# Altium project EMG-Arm-ELEC-V2.0.PrjPcb (part 4 of 4)

## Sheet Electrode_Sheet8.SchDoc
size 420 x 297 mm
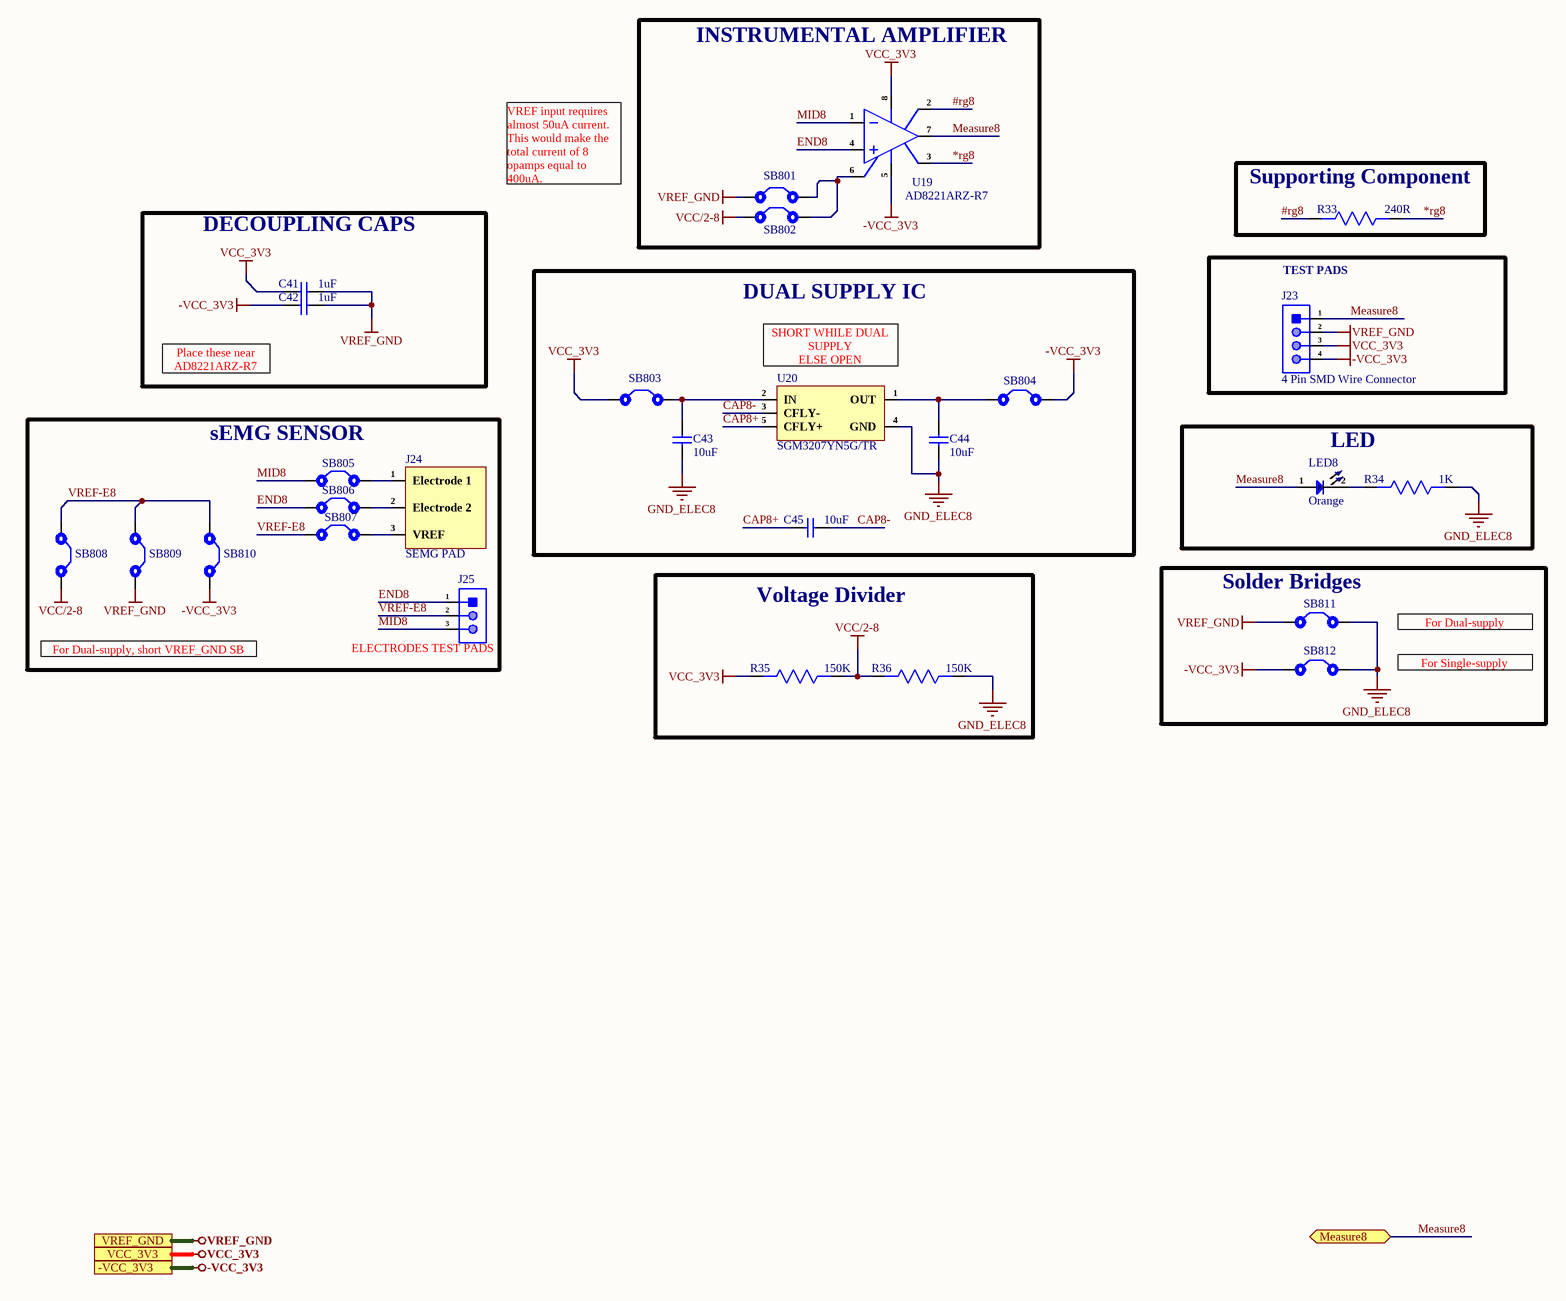
[diagram p10: Electrode_Sheet8.SchDoc]

### Parts
C41  1uF  [Cap-0402]
C42  1uF  [Cap-0402]
C43  10uF  [Cap-0603]
C44  10uF  [Cap-0603]
C45  10uF  [Cap-0603]
J23  4 Pin SMD Wire Connector  [4 Pin SMD Wire CON.]  (no BOM)
J24  SEMG PAD  [SEMG-PAD]
J25  Test Pad SMD 3 Pin  [Test Pad (SMD 3 Pin)]  (value not drawn)  (no BOM)
LED8  Orange  [LED-0603]
R33  240R  [Res-0402]
R34  1K  [Res-0402]
R35  150K  [Res-0402]
R36  150K  [Res-0402]
SB801  Solder Bridge 0402  [Solder Bridge 0402]  (value not drawn)  (no BOM)
SB802  Solder Bridge 0402  [Solder Bridge 0402]  (value not drawn)  (no BOM)
SB803  Solder Bridge 0402  [Solder Bridge 0402]  (value not drawn)  (no BOM)
SB804  Solder Bridge 0402  [Solder Bridge 0402]  (value not drawn)  (no BOM)
SB805  Solder Bridge 0402  [Solder Bridge 0402]  (value not drawn)  (no BOM)
SB806  Solder Bridge 0402  [Solder Bridge 0402]  (value not drawn)  (no BOM)
SB807  Solder Bridge 0402  [Solder Bridge 0402]  (value not drawn)  (no BOM)
SB808  Solder Bridge 0402  [Solder Bridge 0402]  (value not drawn)  (no BOM)
SB809  Solder Bridge 0402  [Solder Bridge 0402]  (value not drawn)  (no BOM)
SB810  Solder Bridge 0402  [Solder Bridge 0402]  (value not drawn)  (no BOM)
SB811  Solder Bridge 0402  [Solder Bridge 0402]  (value not drawn)  (no BOM)
SB812  Solder Bridge 0402  [Solder Bridge 0402]  (value not drawn)  (no BOM)
U19  AD8221ARZ-R7  [SOIC-8]
U20  SGM3207YN5G/TR  [SOT-23-5]

### Blocks framed on the sheet
INSTRUMENTAL AMPLIFIER: SB801 SB802 U19
Supporting Component: R33
DECOUPLING CAPS: C41 C42
TEST PADS: J23
DUAL SUPPLY IC: C43-C45 SB803 SB804 U20
sEMG SENSOR: J24 J25 SB805-SB810
LED: LED8 R34
Voltage Divider: R35 R36
Solder Bridges: SB811 SB812

### Ports
-VCC_3V3, Measure8 (bidir), VCC_3V3, VREF_GND

### Nets
-VCC_3V3: C42.1 J23.4 SB804.2 SB810.2 SB812.1 U19.5(V-) ; port -VCC_3V3
GND_ELEC8: C43.1 C44.1 R34.1 R36.2 SB811.2 SB812.2 U20.4(GND)
VCC/2-8: R35.2 R36.1 SB802.1 SB808.2
VCC_3V3: C41.1 J23.3 R35.1 SB803.1 U19.8(V+) ; port VCC_3V3
VREF_GND: C41.2 C42.2 J23.2 SB801.1 SB809.2 SB811.1 ; port VREF_GND
#rg8: R33.2 U19.2(RG)
*rg8: R33.1 U19.3(RG)
CAP8+: C45.1 U20.5(CFLY+)
CAP8-: C45.2 U20.3(CFLY-)
END8: J25.1 SB806.1 U19.4(IN+)
Measure8: J23.1 LED8.1 U19.7(VOUT) ; port Measure8
MID8: J25.3 SB805.1 U19.1(IN-)
VREF-E8: J25.2 SB807.1 SB808.1 SB809.1 SB810.1
NetC43_2: C43.2 SB803.2 U20.2(IN)
NetC44_2: C44.2 SB804.1 U20.1(OUT)
NetJ24_1: J24.1(Electrode_1) SB805.2
NetJ24_2: J24.2(Electrode_2) SB806.2
NetJ24_3: J24.3(VREF) SB807.2
NetLED8_2: LED8.2 R34.2
NetSB801_2: SB801.2 SB802.2 U19.6(REF)

### Notes on the sheet
- VREF input requires almost 50uA current. This would make the total current of 8 opamps equal to 400uA.
- Place these near AD8221ARZ-R7
- (near U20) SHORT WHILE DUAL SUPPLY
  ELSE OPEN
- For Dual-supply, short VREF_GND SB
- (near J25) ELECTRODES TEST PADS
- For Dual-supply
- For Single-supply
- File:
- Title:
- Date:
- Page
- Num:
- Total:
- Drawn By: Huzaifa Ali

### Library data of the parts
C41 C42 = CC0402KRX5R7BB105: CAP CER 1UF 16V X5R 0402; Manufacturer: Yageo; Tolerance: 10%; Item Type: Capacitor; Supplier 1: Digi-Key; Manufacturer Part Number: CC0402KRX5R7BB105; Stock 1: 1405667; Pricing 1: 1=0.36, 10=0.252, 100=0.1512, 500=0.1134, 1000=0.09576, 2500=0.09072, 5000=0.08568 (USD); Mount: Surface Mount; Case/Package: 0402; Weight: 2.3E-05oz; Case Code (Imperial): 0402; Case Code (Metric): 1005; Min Operating Temperature: -55°C; Max Operating Temperature: 85°C; Capacitance: 1uF; Dielectric: X5R; Packaging: Tape and Reel; Voltage Rating (DC): 16V; Voltage Rating: 16V; Termination: SMD/SMT; Composition: Ceramic; Length: 1mm; Height: 0.5mm; Width: 0.02inch; Thickness: 0.022inch; Depth: 0.5mm; Radiation Hardening: No; Lead Free: Lead Free; Halogen Free: Halogen Free; ComponentLink1URL: http://www.yageo.com/documents/recent/UPY-GPHC_X5R_4V-to-50V_12.pdf?src-supplier=Avnet+Europe; ComponentLink1Description: http://www.yageo.com/documents/recent/UPY-GPHC_X5R_4V-to-50V_12.pdf?src-supplier=Avnet+Europe; Supplier Part Number 1: 311-1691-6-ND; LCSC Part Number: C325464
C43-C45 = CL10A106MA8NRNC: CAP CER 10UF 25V X5R 0603; Manufacturer: Samsung; Tolerance: 20%; Supplier 1: Avnet; Manufacturer Part Number: CL10A106MA8NRNC; RoHS: Yes; Category: Ceramic Capacitors; Pricing 1: 4000=0.03753, 8000=0.03700, 16000=0.03595, 24000=0.03515, 32000=0.03383, 40000=0.03304, 400000=0.03225 (USD); Mount: Surface Mount; Case/Package: 0603; Case Code (Metric): 1608; Case Code (Imperial): 0603; Contact Plating: Tin; Min Operating Temperature: -55°C; Max Operating Temperature: 85°C; Package Quantity: 1; Packaging: Tape and Reel; Capacitance: 10uF; Voltage Rating: 25V; Dielectric: X5R; Termination: Wraparound; Series: CL; Construction: Flat; Length: 0.063inch; Width: 0.031inch; Thickness: 0.035inch; Lead Free: Lead Free; RoHS Compliant: Yes; ComponentLink1URL: https://datasheet.ciiva.com/25766/cl10a106ma8nrnc-25766562.pdf?src-supplier=Digi-Key; ComponentLink1Description: https://datasheet.ciiva.com/25766/cl10a106ma8nrnc-25766562.pdf?src-supplier=Digi-Key; Supplier Part Number 1: CL10A106MA8NRNC; LCSC Part Number: C96446
J23 = 4 Pin SMD Wire Connector: Wire Connecting Pads; Item Type: SMD Pads; Manufacturer Part Number: 4 Pin SMD Wire Connector
J24 = SEMG PAD: Sensor Connecting Pads
J25 = Test Pad SMD 3 Pin: Test Pad
LED8 = 19-217/S2C-AQ1R1B/3T: 0603(H=0.4mm) λD=600.5~612.5nm VR=5V VF=1.7V~2.2V IF=25mA PD=60mW; Manufacturer: Everlight; Item Type: LED; Supplier 1: Digi-Key; Manufacturer Part Number: 19-217/S2C-AQ1R1B/3T; RoHS: No; Category: LEDs; Supplier Part Number 1: 1080-19-217/S2C-AQ1R1B/3TTR-ND; LCSC Part Number: C146215; ComponentLink1Description: LCSC; ComponentLink1URL: https://www.lcsc.com/product-detail/Light-Emitting-Diodes-LED_Everlight-Elec-19-217-S2C-AQ1R1B-3T_C146215.html
R33 = RC0402FR-07240RL: RES 240 OHM 1% 1/16W 0402; Manufacturer: Yageo; Power Rating: 63mW; Temperature Coefficient: 100ppm/°C; Voltage Rating (DC): 50V; Supplier 1: Mouser; Manufacturer Part Number: RC0402FR-07240RL; RoHS: Yes; Category: Chip SMD Resistors; Stock 1: 1903202; Pricing 1: 1=0.10000, 10=0.01200, 50=0.01200, 100=0.00500, 1000=0.00300, 10000=0.00100 (USD); Case/Package: 0402; Case Code (Metric): 1005; Case Code (Imperial): 0402; Size Code: 0402; Min Operating Temperature: -55°C; Max Operating Temperature: 155°C; Resistance: 240R; Tolerance: 1%; Packaging: Tape and Reel; Resistor Type: Thick Film; Voltage Rating: 50V; Package Quantity: 1; Number of Terminations: 2; Termination: SMD/SMT; Max Power Dissipation: 63mW; Features: Moisture Resistant; Series: RC; Construction: Rectangular; Resistance Tolerance: 1%; Length: 1mm; Width: 0.02inch; Height: 0.016inch; Depth: 0.5mm; REACH SVHC: Unknown; Lead Free: Lead Free; RoHS Compliant: Yes; Military Standard: Not; ComponentLink1URL: https://datasheet.ciiva.com/7849/1018594-7849915.pdf?src-supplier=Element14; ComponentLink1Description: https://datasheet.ciiva.com/7849/1018594-7849915.pdf?src-supplier=Element14; ComponentLink2URL: https://datasheet.ciiva.com/7849/1018594-7849916.pdf?src-supplier=Element14; ComponentLink2Description: https://datasheet.ciiva.com/7849/1018594-7849916.pdf?src-supplier=Element14; ComponentLink3URL: https://datasheet.ciiva.com/2519/pyu-r-int-thick-7-2519157.pdf?src-supplier=Digi-Key; ComponentLink3Description: https://datasheet.ciiva.com/2519/pyu-r-int-thick-7-2519157.pdf?src-supplier=Digi-Key; ComponentLink4URL: https://datasheet.ciiva.com/2519/pyu-r-int-thick-7-2519158.pdf?src-supplier=Digi-Key; ComponentLink4Description: https://datasheet.ciiva.com/2519/pyu-r-int-thick-7-2519158.pdf?src-supplier=Digi-Key; ComponentLink5URL: https://datasheet.ciiva.com/2519/pyu-r-int-thick-7-2519156.pdf?src-supplier=Digi-Key; ComponentLink5Description: https://datasheet.ciiva.com/2519/pyu-r-int-thick-7-2519156.pdf?src-supplier=Digi-Key; ComponentLink6URL: https://datasheet.ciiva.com/12669/pyu-rc0402-51-rohs-l-6-r-12669689.pdf?src-supplier=Mouser; ComponentLink6Description: https://datasheet.ciiva.com/12669/pyu-rc0402-51-rohs-l-6-r-12669689.pdf?src-supplier=Mouser; ComponentLink7URL: https://datasheet.ciiva.com/17419/pyu-rc0402-51-rohs-l-6-r-17419482.pdf?src-supplier=Future+Electronics; ComponentLink7Description: https://datasheet.ciiva.com/17419/pyu-rc0402-51-rohs-l-6-r-17419482.pdf?src-supplier=Future+Electronics; Supplier Part Number 1: 603-RC0402FR-07240RL
R34 = RC0402JR-071KL: RES 1K OHM 5% 1/16W 0402; Manufacturer: Yageo; Resistance: 1kR; Power Rating: 62.5mW; Voltage Rating: 50V; Temperature Coefficient: 100ppm/°C; Max Power Dissipation: 63mW; Item Type: Resistor; Supplier 1: Digi-Key; Manufacturer Part Number: RC0402JR-071KL; RoHS: Yes; Category: Chip SMD Resistors; Stock 1: 452315; Pricing 1: 1=0.10000, 10=0.01300, 100=0.00540, 1000=0.00244, 2500=0.00212, 5000=0.00175 (USD); Case/Package: 0402; Case Code (Imperial): 0402; Case Code (Metric): 1005; Size Code: 0402; Min Operating Temperature: -55°C; Max Operating Temperature: 155°C; Tolerance: 5%; Packaging: Tape and Reel; Package Quantity: 1; Termination: SMD/SMT; Resistor Type: Thick Film; Number of Terminations: 2; Features: Moisture Resistant; Series: RC; Resistance Tolerance: 5%; Construction: Rectangular; Length: 0.039inch; Width: 0.02inch; Height: 0.016inch; Depth: 0.5mm; REACH SVHC: No SVHC; Military Standard: Not; Lead Free: Lead Free; RoHS Compliant: Yes; ComponentLink1URL: https://datasheet.ciiva.com/7983/1018594-7983558.pdf?src-supplier=Element14; ComponentLink1Description: https://datasheet.ciiva.com/7983/1018594-7983558.pdf?src-supplier=Element14; ComponentLink2URL: https://datasheet.ciiva.com/2452/pyu-r-int-thick-7-2452756.pdf?src-supplier=Digi-Key; ComponentLink2Description: https://datasheet.ciiva.com/2452/pyu-r-int-thick-7-2452756.pdf?src-supplier=Digi-Key; ComponentLink3URL: https://datasheet.ciiva.com/2452/pyu-r-int-thick-7-2452757.pdf?src-supplier=Digi-Key; ComponentLink3Description: https://datasheet.ciiva.com/2452/pyu-r-int-thick-7-2452757.pdf?src-supplier=Digi-Key; ComponentLink4URL: https://datasheet.ciiva.com/2452/pyu-r-int-thick-7-2452755.pdf?src-supplier=Digi-Key; ComponentLink4Description: https://datasheet.ciiva.com/2452/pyu-r-int-thick-7-2452755.pdf?src-supplier=Digi-Key; ComponentLink5URL: https://datasheet.ciiva.com/7850/1018594-7850170.pdf?src-supplier=Element14; ComponentLink5Description: https://datasheet.ciiva.com/7850/1018594-7850170.pdf?src-supplier=Element14; ComponentLink6URL: https://datasheet.ciiva.com/7850/1018594-7850171.pdf?src-supplier=Element14; ComponentLink6Description: https://datasheet.ciiva.com/7850/1018594-7850171.pdf?src-supplier=Element14; ComponentLink7URL: https://datasheet.ciiva.com/17081/pyu-rc0402-51-rohs-l-6-r-17081438.pdf?src-supplier=Future+Electronics; ComponentLink7Description: https://datasheet.ciiva.com/17081/pyu-rc0402-51-rohs-l-6-r-17081438.pdf?src-supplier=Future+Electronics; Supplier Part Number 1: 311-1.0KJRCT-ND; LCSC Part Number: C105637
R35 R36 = RC0402JR-07150KL: RES SMD 0402 150kOhm 5% Paper T/R; Manufacturer: Yageo; Resistance: 150kR; Power Rating: 63mW; Voltage Rating: 50V; Temperature Coefficient: 100ppm/°C; Item Type: Resistor; Supplier 1: Arrow Electronics; Manufacturer Part Number: RC0402JR-07150KL; RoHS: Yes; Category: Chip SMD Resistors; Stock 1: 170000; Pricing 1: 10000=0.00100 (USD); Case/Package: 0402; Case Code (Metric): 1005; Case Code (Imperial): 0402; Weight: 2.3E-05oz; Size Code: 0402; Min Operating Temperature: -55°C; Max Operating Temperature: 155°C; Package Quantity: 1; Tolerance: 5%; Packaging: Tape and Reel; Resistor Type: Thick Film; Number of Terminations: 2; Termination: SMD/SMT; Max Power Dissipation: 63mW; Features: Moisture Resistant; Series: RC; Construction: Rectangular; Resistance Tolerance: 5%; Length: 1mm; Width: 0.02inch; Height: 0.016inch; Depth: 0.5mm; REACH SVHC: No SVHC; Military Standard: Not; Lead Free: Lead Free; RoHS Compliant: Yes; ComponentLink1URL: https://datasheet.ciiva.com/7983/1018594-7983551.pdf?src-supplier=Element14; ComponentLink1Description: https://datasheet.ciiva.com/7983/1018594-7983551.pdf?src-supplier=Element14; ComponentLink2URL: https://datasheet.ciiva.com/2518/pyu-r-int-thick-7-2518929.pdf?src-supplier=Digi-Key; ComponentLink2Description: https://datasheet.ciiva.com/2518/pyu-r-int-thick-7-2518929.pdf?src-supplier=Digi-Key; ComponentLink3URL: https://datasheet.ciiva.com/2518/pyu-r-int-thick-7-2518930.pdf?src-supplier=Digi-Key; ComponentLink3Description: https://datasheet.ciiva.com/2518/pyu-r-int-thick-7-2518930.pdf?src-supplier=Digi-Key; ComponentLink4URL: https://datasheet.ciiva.com/2518/pyu-r-int-thick-7-2518928.pdf?src-supplier=Digi-Key; ComponentLink4Description: https://datasheet.ciiva.com/2518/pyu-r-int-thick-7-2518928.pdf?src-supplier=Digi-Key; ComponentLink5URL: https://datasheet.ciiva.com/7850/1018594-7850149.pdf?src-supplier=Element14; ComponentLink5Description: https://datasheet.ciiva.com/7850/1018594-7850149.pdf?src-supplier=Element14; ComponentLink6URL: https://datasheet.ciiva.com/17072/pyu-rc0402-51-rohs-l-6-r-17072379.pdf?src-supplier=Future+Electronics; ComponentLink6Description: https://datasheet.ciiva.com/17072/pyu-rc0402-51-rohs-l-6-r-17072379.pdf?src-supplier=Future+Electronics; ComponentLink7URL: https://datasheet.ciiva.com/15189/getdatasheetpartid-251830-15189543.pdf?src-supplier=Verical; ComponentLink7Description: https://datasheet.ciiva.com/15189/getdatasheetpartid-251830-15189543.pdf?src-supplier=Verical; Supplier Part Number 1: RC0402JR-07150KL; LCSC Part Number: C137919
SB801-SB812 = Solder Bridge 0402: Solder Bridge ON; Manufacturer Part Number: Solder Bridge 0402; Item Type: Solder Bridge
U19 = AD8221ARZ-R7: IC OPAMP INSTR 825KHZ 8SOIC; Manufacturer: Analog Devices; Number of Channels: 1; Common Mode Rejection Ratio: 80dB; Min Dual Supply Voltage: 2.3V; Max Dual Supply Voltage: 18V; Slew Rate: 2.5V/µs; Nominal Supply Current: 1mA; Max Power Dissipation: 200mW; Bandwidth: 562kHz; Input Bias Current: 1.5nA; Input Offset Voltage (Vos): 60uV; Output Current per Channel: 18mA; Power Supply Rejection Ratio (PSRR): 130dB; Voltage Gain: 60dB; Input Resistance: 100GR; Quiescent Current: 900uA; Operating Supply Voltage: 36V; Supplier 1: Mouser; Manufacturer Part Number: AD8221ARZ-R7; RoHS: Yes; Category: Amplifiers - Op Amps, Buffer, Instrumentation; Pricing 1: 1=7.37000, 10=6.66000, 25=6.35000, 50=6.35000, 100=5.51000, 250=5.27000, 500=4.80000, 1000=4.37000, 10000=4.37000 (USD); Case/Package: SOIC; Number of Pins: 8; Contact Plating: Tin,Matte; Min Operating Temperature: -40°C; Max Operating Temperature: 85°C; -3db Bandwidth: 825kHz; Package Quantity: 1000; Packaging: Tape and Reel; Number of Circuits: 1; Operating Supply Current: 1mA; Number of Elements: 1; Power Dissipation: 200mW; Series: -; Supply Current: 1mA; Radiation Hardening: No; Lead Free: Contains Lead; RoHS Compliant: Yes; ComponentLink1URL: https://datasheet.ciiva.com/15128/getdatasheetpartid-313520-15128733.pdf?src-supplier=Verical; ComponentLink1Description: https://datasheet.ciiva.com/15128/getdatasheetpartid-313520-15128733.pdf?src-supplier=Verical; ComponentLink2URL: https://datasheet.ciiva.com/2975/ad8221-2975658.pdf?src-supplier=Avnet; ComponentLink2Description: https://datasheet.ciiva.com/2975/ad8221-2975658.pdf?src-supplier=Avnet; ComponentLink3URL: https://datasheet.ciiva.com/2975/ad8221-2975980.pdf?src-supplier=Avnet; ComponentLink3Description: https://datasheet.ciiva.com/2975/ad8221-2975980.pdf?src-supplier=Avnet; ComponentLink4URL: https://datasheet.ciiva.com/6628/ad8221-6628618.pdf?src-supplier=Digi-Key; ComponentLink4Description: https://datasheet.ciiva.com/6628/ad8221-6628618.pdf?src-supplier=Digi-Key; ComponentLink5URL: https://datasheet.ciiva.com/6628/ad8221-6628619.pdf?src-supplier=Digi-Key; ComponentLink5Description: https://datasheet.ciiva.com/6628/ad8221-6628619.pdf?src-supplier=Digi-Key; ComponentLink6URL: https://datasheet.ciiva.com/6628/ad8221-6628617.pdf?src-supplier=Digi-Key; ComponentLink6Description: https://datasheet.ciiva.com/6628/ad8221-6628617.pdf?src-supplier=Digi-Key; ComponentLink7URL: https://datasheet.ciiva.com/48709/001249009-da-01-en-ic-amp-inst-prec-ad8221arz-r7-soic-8-adi-48709526.pdf?src-supplier=Conrad; ComponentLink7Description: https://datasheet.ciiva.com/48709/001249009-da-01-en-ic-amp-inst-prec-ad8221arz-r7-soic-8-adi-48709526.pdf?src-supplier=Conrad; Supplier Part Number 1: 584-AD8221ARZ-R7; LCSC Part Number: C13342; Item Type: IC
U20 = SGM3207YN5G/TR: NO Charge pump 1 -5.5V~-1.4V 1.4V~5.5V 60mA 19kHz SOT-23-5 DC-DC Converters ROHS; Manufacturer: SG Micro; Item Type: IC; Supplier 1: Avnet; Manufacturer Part Number: SGM3207YN5G/TR; RoHS: No; Category: Uncategorized; Pricing 1: 3000=0.38750, 6000=0.36250, 12000=0.33750, 18000=0.32500, 24000=0.31250, 30000=0.31250, 300000=0.30500 (USD); LCSC Part Number: C80403; Supplier Part Number 1: SGM3207YN5G/TR

## Nets that join several sheets
-VCC_3V3: Opamp_Sheet (C7.1 SB11.2 U5.11 U6.11), Connector-Sheet (SB29.1), Electrode_Sheet1 (6 pins), Electrode_Sheet2 (6 pins), Electrode_Sheet3 (6 pins), Electrode_Sheet4 (6 pins), Electrode_Sheet5 (6 pins), Electrode_Sheet6 (6 pins), Electrode_Sheet7 (6 pins), Electrode_Sheet8 (6 pins)
GND: Opamp_Sheet (7 pins), Connector-Sheet (7 pins)
VCC_3V3: Opamp_Sheet (8 pins), Connector-Sheet (J4.2 R7.2 R8.2), Electrode_Sheet1 (5 pins), Electrode_Sheet2 (5 pins), Electrode_Sheet3 (5 pins), Electrode_Sheet4 (5 pins), Electrode_Sheet5 (5 pins), Electrode_Sheet6 (5 pins), Electrode_Sheet7 (5 pins), Electrode_Sheet8 (5 pins)
VREF: Opamp_Sheet (U4.1 U4.4), Connector-Sheet (SB30.1)
VREF_GND: Connector-Sheet (SB28.1 SB30.2), Electrode_Sheet1 (6 pins), Electrode_Sheet2 (6 pins), Electrode_Sheet3 (6 pins), Electrode_Sheet4 (6 pins), Electrode_Sheet5 (6 pins), Electrode_Sheet6 (6 pins), Electrode_Sheet7 (6 pins), Electrode_Sheet8 (6 pins)
Measure1: Opamp_Sheet (SB1.1 SB16.1), Electrode_Sheet1 (J1.1 LED1.1 U1.7)
Measure2: Opamp_Sheet (SB2.1 SB17.1), Electrode_Sheet2 (J5.1 LED2.1 U7.7)
Measure3: Opamp_Sheet (SB3.1 SB18.1), Electrode_Sheet3 (J8.1 LED3.1 U9.7)
Measure4: Opamp_Sheet (SB4.1 SB19.1), Electrode_Sheet4 (J11.1 LED4.1 U11.7)
Measure5: Opamp_Sheet (SB5.1 SB24.1), Electrode_Sheet5 (J14.1 LED5.1 U13.7)
Measure6: Opamp_Sheet (SB6.1 SB25.1), Electrode_Sheet6 (J17.1 LED6.1 U15.7)
Measure7: Opamp_Sheet (SB7.1 SB26.1), Electrode_Sheet7 (J20.1 LED7.1 U17.7)
Measure8: Opamp_Sheet (SB8.1 SB27.1), Electrode_Sheet8 (J23.1 LED8.1 U19.7)
SENSOR1: Opamp_Sheet (SB1.2 SB12.2), Connector-Sheet (J4.15)
SENSOR2: Opamp_Sheet (SB2.2 SB13.2), Connector-Sheet (J4.14)
SENSOR3: Opamp_Sheet (SB3.2 SB14.2), Connector-Sheet (J4.13)
SENSOR4: Opamp_Sheet (SB4.2 SB15.2), Connector-Sheet (J4.12)
SENSOR5: Opamp_Sheet (SB5.2 SB20.2), Connector-Sheet (J4.11)
SENSOR6: Opamp_Sheet (SB6.2 SB21.2), Connector-Sheet (J4.10)
SENSOR7: Opamp_Sheet (SB7.2 SB22.2), Connector-Sheet (J4.9)
SENSOR8: Opamp_Sheet (SB8.2 SB23.2), Connector-Sheet (J4.8)